# Altium schematic sheet Top_Sheet.SchDoc
size A4; DocumentNumber: 1; SheetNumber: 1; SheetTotal: 27
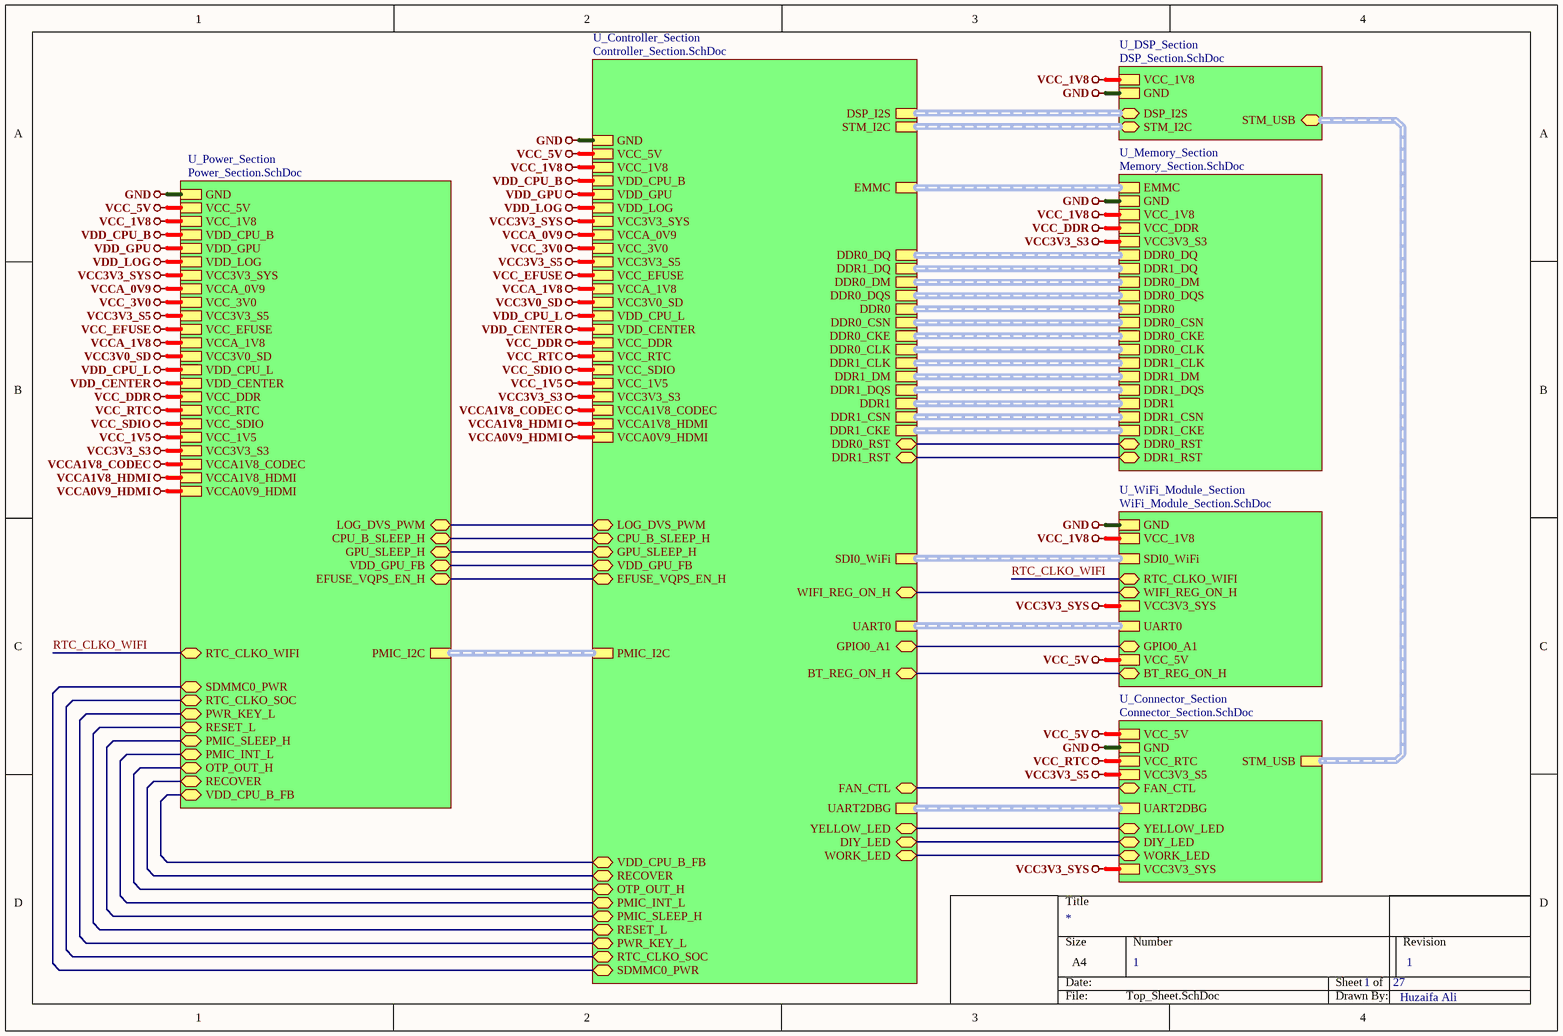
[diagram p0: Top_Sheet.SchDoc]

## Sub-sheets
U_Connector_Section = Connector_Section.SchDoc: VCC_5V, GND, STM_USB (harness STM_USB), VCC_RTC, VCC3V3_S5, FAN_CTL (bidir), UART2DBG (harness UART2DBG), YELLOW_LED (bidir), DIY_LED (bidir), WORK_LED (bidir), VCC3V3_SYS
U_Controller_Section = Controller_Section.SchDoc: LOG_DVS_PWM (bidir), CPU_B_SLEEP_H (bidir), GPU_SLEEP_H (bidir), VDD_GPU_FB (bidir), EFUSE_VQPS_EN_H (bidir), GND, VCC_5V, VCC_1V8, VDD_CPU_B, VDD_GPU, VDD_LOG, VCC3V3_SYS, VCCA_0V9, VCC_3V0, VCC3V3_S5, VCC_EFUSE, VCCA_1V8, VCC3V0_SD, VDD_CPU_L, VDD_CENTER, VCC_DDR, VCC_RTC, VCC_SDIO, VCC_1V5, VCC3V3_S3, VCCA1V8_CODEC, VCCA1V8_HDMI, VCCA0V9_HDMI, EMMC (harness EMMC), FAN_CTL (bidir), PWR_KEY_L (bidir), PMIC_I2C (harness PMIC_I2C), DSP_I2S (harness DSP_I2S), UART0 (harness UART0), UART2DBG (harness UART2DBG), STM_I2C (harness STM_I2C), OTP_OUT_H (bidir), PMIC_INT_L (bidir), RECOVER (bidir), RTC_CLKO_SOC (bidir), RESET_L (bidir), PMIC_SLEEP_H (bidir), YELLOW_LED (bidir), DIY_LED (bidir), WIFI_REG_ON_H (bidir), GPIO0_A1 (bidir), BT_REG_ON_H (bidir), SDI0_WiFi (harness SDI0_WiFi), WORK_LED (bidir), VDD_CPU_B_FB (bidir), SDMMC0_PWR (bidir), DDR0_DQ, DDR1_DQ, DDR0_DM, DDR0_DQS, DDR0, DDR0_CSN, DDR0_CKE, DDR0_CLK, DDR1_CLK, DDR1_DM, DDR1_DQS, DDR1, DDR1_CSN, DDR1_CKE, DDR0_RST (bidir), DDR1_RST (bidir)
U_DSP_Section = DSP_Section.SchDoc: VCC_1V8, GND, DSP_I2S (bidir, harness DSP_I2S), STM_I2C (bidir, harness STM_I2C), STM_USB (bidir, harness STM_USB)
U_Memory_Section = Memory_Section.SchDoc: EMMC (harness EMMC), GND, VCC_1V8, VCC_DDR, VCC3V3_S3, DDR0_DQ, DDR1_DQ, DDR0_DM, DDR0_DQS, DDR0, DDR0_CSN, DDR0_CKE, DDR0_CLK, DDR1_CLK, DDR1_DM, DDR1_DQS, DDR1, DDR1_CSN, DDR1_CKE, DDR0_RST (bidir), DDR1_RST (bidir)
U_Power_Section = Power_Section.SchDoc: GND, VCC_5V, VCC_1V8, VDD_CPU_B, VDD_GPU, VDD_LOG, VCC3V3_SYS, VCCA_0V9, VCC_3V0, VCC3V3_S5, VCC_EFUSE, VCCA_1V8, VCC3V0_SD, VDD_CPU_L, VDD_CENTER, VCC_DDR, VCC_RTC, VCC_SDIO, VCC_1V5, VCC3V3_S3, VCCA1V8_CODEC, VCCA1V8_HDMI, VCCA0V9_HDMI, PMIC_I2C (harness PMIC_I2C), LOG_DVS_PWM (bidir), CPU_B_SLEEP_H (bidir), GPU_SLEEP_H (bidir), VDD_GPU_FB (bidir), EFUSE_VQPS_EN_H (bidir), RTC_CLKO_WIFI (bidir), RESET_L (bidir), PMIC_SLEEP_H (bidir), PMIC_INT_L (bidir), OTP_OUT_H (bidir), RECOVER (bidir), VDD_CPU_B_FB (bidir), PWR_KEY_L (bidir), RTC_CLKO_SOC (bidir), SDMMC0_PWR (bidir)
U_WiFi_Module_Section = WiFi_Module_Section.SchDoc: GND, VCC_1V8, SDI0_WiFi (harness SDI0_WiFi), RTC_CLKO_WIFI (bidir), WIFI_REG_ON_H (bidir), VCC3V3_SYS, UART0 (harness UART0), GPIO0_A1 (bidir), VCC_5V, BT_REG_ON_H (bidir)

## Nets
GND: sheet U_DSP_Section/GND, sheet U_WiFi_Module_Section/GND, sheet U_Connector_Section/GND, sheet U_Power_Section/GND, sheet U_Controller_Section/GND, sheet U_Memory_Section/GND
VCC3V0_SD: sheet U_Power_Section/VCC3V0_SD, sheet U_Controller_Section/VCC3V0_SD
VCC3V3_S3: sheet U_Power_Section/VCC3V3_S3, sheet U_Controller_Section/VCC3V3_S3, sheet U_Memory_Section/VCC3V3_S3
VCC3V3_S5: sheet U_Connector_Section/VCC3V3_S5, sheet U_Power_Section/VCC3V3_S5, sheet U_Controller_Section/VCC3V3_S5
VCC3V3_SYS: sheet U_WiFi_Module_Section/VCC3V3_SYS, sheet U_Connector_Section/VCC3V3_SYS, sheet U_Power_Section/VCC3V3_SYS, sheet U_Controller_Section/VCC3V3_SYS
VCC_1V5: sheet U_Power_Section/VCC_1V5, sheet U_Controller_Section/VCC_1V5
VCC_1V8: sheet U_DSP_Section/VCC_1V8, sheet U_WiFi_Module_Section/VCC_1V8, sheet U_Power_Section/VCC_1V8, sheet U_Controller_Section/VCC_1V8, sheet U_Memory_Section/VCC_1V8
VCC_3V0: sheet U_Power_Section/VCC_3V0, sheet U_Controller_Section/VCC_3V0
VCC_5V: sheet U_WiFi_Module_Section/VCC_5V, sheet U_Connector_Section/VCC_5V, sheet U_Power_Section/VCC_5V, sheet U_Controller_Section/VCC_5V
VCC_DDR: sheet U_Power_Section/VCC_DDR, sheet U_Controller_Section/VCC_DDR, sheet U_Memory_Section/VCC_DDR
VCC_EFUSE: sheet U_Power_Section/VCC_EFUSE, sheet U_Controller_Section/VCC_EFUSE
VCC_RTC: sheet U_Connector_Section/VCC_RTC, sheet U_Power_Section/VCC_RTC, sheet U_Controller_Section/VCC_RTC
VCC_SDIO: sheet U_Power_Section/VCC_SDIO, sheet U_Controller_Section/VCC_SDIO
VCCA0V9_HDMI: sheet U_Power_Section/VCCA0V9_HDMI, sheet U_Controller_Section/VCCA0V9_HDMI
VCCA1V8_CODEC: sheet U_Power_Section/VCCA1V8_CODEC, sheet U_Controller_Section/VCCA1V8_CODEC
VCCA1V8_HDMI: sheet U_Power_Section/VCCA1V8_HDMI, sheet U_Controller_Section/VCCA1V8_HDMI
VCCA_0V9: sheet U_Power_Section/VCCA_0V9, sheet U_Controller_Section/VCCA_0V9
VCCA_1V8: sheet U_Power_Section/VCCA_1V8, sheet U_Controller_Section/VCCA_1V8
VDD_CENTER: sheet U_Power_Section/VDD_CENTER, sheet U_Controller_Section/VDD_CENTER
VDD_CPU_B: sheet U_Power_Section/VDD_CPU_B, sheet U_Controller_Section/VDD_CPU_B
VDD_CPU_L: sheet U_Power_Section/VDD_CPU_L, sheet U_Controller_Section/VDD_CPU_L
VDD_GPU: sheet U_Power_Section/VDD_GPU, sheet U_Controller_Section/VDD_GPU
VDD_LOG: sheet U_Power_Section/VDD_LOG, sheet U_Controller_Section/VDD_LOG
RTC_CLKO_WIFI: sheet U_WiFi_Module_Section/RTC_CLKO_WIFI, sheet U_Power_Section/RTC_CLKO_WIFI
(unnamed): sheet U_WiFi_Module_Section/WIFI_REG_ON_H, sheet U_Controller_Section/WIFI_REG_ON_H
(unnamed): sheet U_WiFi_Module_Section/GPIO0_A1, sheet U_Controller_Section/GPIO0_A1
(unnamed): sheet U_WiFi_Module_Section/BT_REG_ON_H, sheet U_Controller_Section/BT_REG_ON_H
(unnamed): sheet U_Connector_Section/FAN_CTL, sheet U_Controller_Section/FAN_CTL
(unnamed): sheet U_Connector_Section/YELLOW_LED, sheet U_Controller_Section/YELLOW_LED
(unnamed): sheet U_Connector_Section/DIY_LED, sheet U_Controller_Section/DIY_LED
(unnamed): sheet U_Connector_Section/WORK_LED, sheet U_Controller_Section/WORK_LED
(unnamed): sheet U_Power_Section/LOG_DVS_PWM, sheet U_Controller_Section/LOG_DVS_PWM
(unnamed): sheet U_Power_Section/CPU_B_SLEEP_H, sheet U_Controller_Section/CPU_B_SLEEP_H
(unnamed): sheet U_Power_Section/GPU_SLEEP_H, sheet U_Controller_Section/GPU_SLEEP_H
(unnamed): sheet U_Power_Section/VDD_GPU_FB, sheet U_Controller_Section/VDD_GPU_FB
(unnamed): sheet U_Power_Section/EFUSE_VQPS_EN_H, sheet U_Controller_Section/EFUSE_VQPS_EN_H
(unnamed): sheet U_Power_Section/RESET_L, sheet U_Controller_Section/RESET_L
(unnamed): sheet U_Power_Section/PMIC_SLEEP_H, sheet U_Controller_Section/PMIC_SLEEP_H
(unnamed): sheet U_Power_Section/PMIC_INT_L, sheet U_Controller_Section/PMIC_INT_L
(unnamed): sheet U_Power_Section/OTP_OUT_H, sheet U_Controller_Section/OTP_OUT_H
(unnamed): sheet U_Power_Section/RECOVER, sheet U_Controller_Section/RECOVER
(unnamed): sheet U_Power_Section/VDD_CPU_B_FB, sheet U_Controller_Section/VDD_CPU_B_FB
(unnamed): sheet U_Power_Section/PWR_KEY_L, sheet U_Controller_Section/PWR_KEY_L
(unnamed): sheet U_Power_Section/RTC_CLKO_SOC, sheet U_Controller_Section/RTC_CLKO_SOC
(unnamed): sheet U_Power_Section/SDMMC0_PWR, sheet U_Controller_Section/SDMMC0_PWR
(unnamed): sheet U_Controller_Section/DDR0_RST, sheet U_Memory_Section/DDR0_RST
(unnamed): sheet U_Controller_Section/DDR1_RST, sheet U_Memory_Section/DDR1_RST

## Buses and harness runs
harness sheet U_Connector_Section/STM_USB = sheet U_DSP_Section/STM_USB
harness sheet U_Connector_Section/UART2DBG = sheet U_Controller_Section/UART2DBG
harness sheet U_Controller_Section/DDR0 = sheet U_Memory_Section/DDR0
harness sheet U_Controller_Section/DDR0_CKE = sheet U_Memory_Section/DDR0_CKE
harness sheet U_Controller_Section/DDR0_CLK = sheet U_Memory_Section/DDR0_CLK
harness sheet U_Controller_Section/DDR0_CSN = sheet U_Memory_Section/DDR0_CSN
harness sheet U_Controller_Section/DDR0_DM = sheet U_Memory_Section/DDR0_DM
harness sheet U_Controller_Section/DDR0_DQ = sheet U_Memory_Section/DDR0_DQ
harness sheet U_Controller_Section/DDR0_DQS = sheet U_Memory_Section/DDR0_DQS
harness sheet U_Controller_Section/DDR1 = sheet U_Memory_Section/DDR1
harness sheet U_Controller_Section/DDR1_CKE = sheet U_Memory_Section/DDR1_CKE
harness sheet U_Controller_Section/DDR1_CLK = sheet U_Memory_Section/DDR1_CLK
harness sheet U_Controller_Section/DDR1_CSN = sheet U_Memory_Section/DDR1_CSN
harness sheet U_Controller_Section/DDR1_DM = sheet U_Memory_Section/DDR1_DM
harness sheet U_Controller_Section/DDR1_DQ = sheet U_Memory_Section/DDR1_DQ
harness sheet U_Controller_Section/DDR1_DQS = sheet U_Memory_Section/DDR1_DQS
harness sheet U_Controller_Section/DSP_I2S = sheet U_DSP_Section/DSP_I2S
harness sheet U_Controller_Section/EMMC = sheet U_Memory_Section/EMMC
harness sheet U_Controller_Section/PMIC_I2C = sheet U_Power_Section/PMIC_I2C
harness sheet U_Controller_Section/SDI0_WiFi = sheet U_WiFi_Module_Section/SDI0_WiFi
harness sheet U_Controller_Section/STM_I2C = sheet U_DSP_Section/STM_I2C
harness sheet U_Controller_Section/UART0 = sheet U_WiFi_Module_Section/UART0

## Notes on the sheet
- 1
- Huzaifa Ali